# Altium project SCD2326功率板-V0.3.PrjPcb
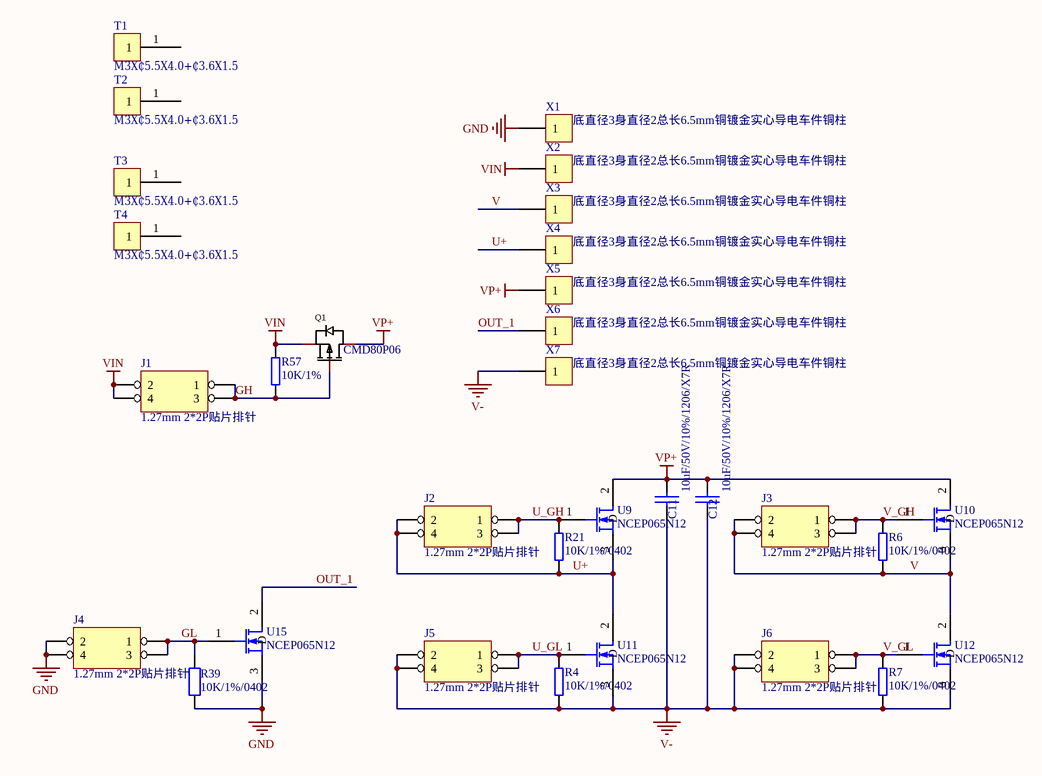
[diagram p0: SCD2326功率板-V0.3.SchDoc]
1 sheet, 31 parts. Net scope: global (net labels, ports and power ports of the same name join across sheets).
Board file: SCD2326功率板-V0.3.PcbDoc

## Sheet SCD2326功率板-V0.3.SchDoc
size A4; SheetNumber: 1; SheetTotal: 1

### Parts
C11  10uF/50V/10%/1206/X7R  [SC1206]
C12  10uF/50V/10%/1206/X7R  [SC1206]
J1  1.27mm 2*2P贴片排针  [CON_1D27_2X2TP]
J2  1.27mm 2*2P贴片排针  [CON_1D27_2X2TP]
J3  1.27mm 2*2P贴片排针  [CON_1D27_2X2TP]
J4  1.27mm 2*2P贴片排针  [CON_1D27_2X2TP]
J5  1.27mm 2*2P贴片排针  [CON_1D27_2X2TP]
J6  1.27mm 2*2P贴片排针  [CON_1D27_2X2TP]
Q1  CMD80P06  [TO-252-2]
R4  10K/1%/0402  [SR0402]
R6  10K/1%/0402  [SR0402]
R7  10K/1%/0402  [SR0402]
R21  10K/1%/0402  [SR0402]
R39  10K/1%/0402  [SR0402]
R57  10K/1%  [SR0402]
T1  M3X₵5.5X4.0+₵3.6X1.5  [M3_TP]
T2  M3X₵5.5X4.0+₵3.6X1.5  [M3_TP]
T3  M3X₵5.5X4.0+₵3.6X1.5  [M3_TP]
T4  M3X₵5.5X4.0+₵3.6X1.5  [M3_TP]
U9  NCEP065N12  [PG-TDSON-8]
U10  NCEP065N12  [PG-TDSON-8]
U11  NCEP065N12  [PG-TDSON-8]
U12  NCEP065N12  [PG-TDSON-8]
U15  NCEP065N12  [PG-TDSON-8]
X1  底直径3身直径2总长6.5mm铜镀金实心导电车件铜柱  [CON_3D0_1TP]
X2  底直径3身直径2总长6.5mm铜镀金实心导电车件铜柱  [CON_3D0_1TP]
X3  底直径3身直径2总长6.5mm铜镀金实心导电车件铜柱  [CON_3D0_1TP]
X4  底直径3身直径2总长6.5mm铜镀金实心导电车件铜柱  [CON_3D0_1TP]
X5  底直径3身直径2总长6.5mm铜镀金实心导电车件铜柱  [CON_3D0_1TP]
X6  底直径3身直径2总长6.5mm铜镀金实心导电车件铜柱  [CON_3D0_1TP]
X7  底直径3身直径2总长6.5mm铜镀金实心导电车件铜柱  [CON_3D0_1TP]

### Nets
GND: J4.2 J4.4 R39.1 U15.3(S) X1.1
V-: C11.1 C12.1 J5.2 J5.4 J6.2 J6.4 R4.2 R7.2 U11.3(S) U12.3(S) X7.1
VIN: J1.2 J1.4 Q1.3(S) R57.2 X2.1
VP+: C11.2 C12.2 Q1.2(D) U9.2(D) U10.2(D) X5.1
GH: J1.1 J1.3 Q1.1(G) R57.1
GL: J4.1 J4.3 R39.2 U15.1(G)
OUT_1: U15.2(D) X6.1
U+: J2.2 J2.4 R21.2 U9.3(S) U11.2(D) X4.1
U_GH: J2.1 J2.3 R21.1 U9.1(G)
U_GL: J5.1 J5.3 R4.1 U11.1(G)
V: J3.2 J3.4 R6.2 U10.3(S) U12.2(D) X3.1
V_GH: J3.1 J3.3 R6.1 U10.1(G)
V_GL: J6.1 J6.3 R7.1 U12.1(G)

Not connected (* = marked no-connect by the designer): T1 1; T2 1; T3 1; T4 1

### Library data of the parts
C11 C12 = CAP: X7R/0402
J1-J6 = HEADER 2X2
Q1 = WSF50P10: Manufacturer: WINSOK(微硕); Add into BOM: yes; Type: P沟道; Drain Source Voltage (Vdss): 100V; Continuous Drain Current (Id): 34A; Power Dissipation (Pd): 96W; Drain Source On Resistance (RDS(on)@Vgs,Id): 32mΩ@10V,18A; Gate Threshold Voltage (Vgs(th)@Id): 2V@250uA; Total Gate Charge (Qg@Vgs): 56nC@10V; Input Capacitance (Ciss@Vds): 2.48nF@50V; Reverse Transfer Capacitance (Crss@Vds): 126pF@50V; Name: WSF50P10; Symbol: WSF50P10; Device: WSF50P10; LCSC Part Name: P沟道 100V 34A; Supplier Part: C2758447; Manufacturer Part: WSF50P10; Supplier Footprint: TO-252-2; JLCPCB Part Class: Extended Part; Datasheet: https://atta.szlcsc.com/upload/public/pdf/source/20210315/C2758447_CEC070518AA9055890F7C5C454C91B6F.pdf; Supplier: LCSC; Convert to PCB: yes; Operating Temperature: -55℃~+150℃@(Tj)
R4 R6 R7 R21 = RES2
R39 = Res2: Resistor; Value: 900OR10M; Published: 8-Jun-2000; LatestRevisionDate: 17-Jul-2002; LatestRevisionNote: Re-released for DXP Platform.; PackageReference: AXIAL-0.4; Publisher: Altium Limited; PackageDescription: Axial Device, Thru-Hole; 2 Leads; 0.4 in Pin Spacing
R57 = RES2: X7R/0603
T1-T4 = M3X₵5.5X10+₵4.1X1.5: https://item.taobao.com/item.htm?id=655855111684&mi_id=00001ooHujBaGzHg-LCBfWhVe6oH8mw_k8j5GujWoe4PlPw&spm=tbpc.boughtlist.suborder_itemtitle.1.4df22e8dmvWkNb
U9-U12 U15 = CXYG_N: 场效应管N沟道; Published: 8-Jun-2000; LatestRevisionDate: 17-Jul-2002; LatestRevisionNote: Re-released for DXP Platform.; Publisher: Altium Limited
X1-X7 = CON1: https://item.taobao.com/item.htm?spm=a1z09.2.0.0.28292e8dsDHJ66&id=616436650412&_u=f1hghf6m80e1